# Altium schematic sheet USB Section.SchDoc: *USB Section
size A4; DocumentNumber: 3; SheetNumber: 3; SheetTotal: 7
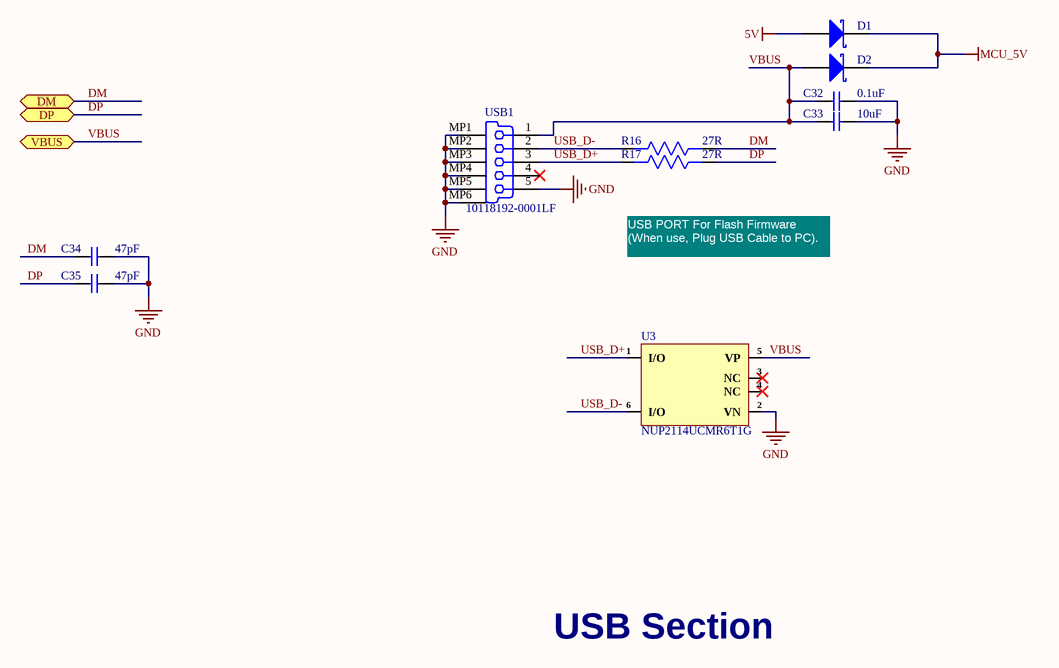
[diagram p0: USB Section.SchDoc]

## Parts
C32  0.1uF  [Cap0402]
C33  10uF  [Cap0402]
C34  47pF  [Cap0402]
C35  47pF  [Cap0402]
D1  PMEG3010ER,115  [SOD123W]  (value not drawn)
D2  PMEG3010ER,115  [SOD123W]  (value not drawn)
R16  27R  [Res0402]
R17  27R  [Res0402]
U3  NUP2114UCMR6T1G  [6-TSOP]
USB1  10118192-0001LF  [Micro Usb Conn SMD]

## Ports
DM (bidir), DP (bidir), VBUS (bidir)

## Nets
5V: D1.A
GND: C32.2 C33.2 C34.2 C35.2 U3.2(VN) USB1.5(GND) USB1.MP1(Tab) USB1.MP2(Tab) USB1.MP3(Tab) USB1.MP4(Tab) USB1.MP5(Tab) USB1.MP6(Tab)
MCU_5V: D1.K D2.K
DM: C34.1 R16.1 ; port DM
DP: C35.1 R17.1 ; port DP
USB_D+: R17.2 U3.1(I/O) USB1.3(D+)
USB_D-: R16.2 U3.6(I/O) USB1.2(D-)
VBUS: C32.1 C33.1 D2.A U3.5(VP) USB1.1(V_BUS_(5V)) ; port VBUS

Not connected (* = marked no-connect by the designer): U3 3(NC)* 4(NC)*; USB1 4(NC)*

## Notes on the sheet
- USB PORT For Flash Firmware
  (When use, Plug USB Cable to PC).
- USB Section

## Library data of the parts
C32 = CC0402KRX5R7BB104: CAP CER 0.1UF 16V X5R 0402; Manufacturer: Yageo; Capacitance: 100nF; Tolerance: 10%; Supplier 1: Digi-Key; Manufacturer Part Number: CC0402KRX5R7BB104; Stock 1: 2577166; Pricing 1: 1=0.1, 10=0.03, 100=0.0135, 500=0.0096, 1000=0.0076, 2500=0.0069, 5000=0.0063 (USD); Mount: Surface Mount; Case/Package: 0402; Number of Pins: 2; Case Code (Metric): 1005; Case Code (Imperial): 0402; Min Operating Temperature: -55°C; Max Operating Temperature: 85°C; Packaging: Tape and Reel; Voltage Rating: 16V; Package Quantity: 1; Voltage Rating (DC): 16V; Dielectric: X5R; Termination: SMD/SMT; Composition: Ceramic; Length: 1mm; Height: 0.5mm; Width: 0.02inch; Thickness: 0.022inch; Depth: 0.5mm; Radiation Hardening: No; REACH SVHC: Unknown; Lead Free: Lead Free; Halogen Free: Halogen Free; ComponentLink1URL: http://www.yageo.com/documents/recent/UPY-GPHC_X5R_4V-to-50V_12.pdf?src-supplier=Avnet; ComponentLink1Description: http://www.yageo.com/documents/recent/UPY-GPHC_X5R_4V-to-50V_12.pdf?src-supplier=Avnet; ComponentLink2URL: http://www.yageo.com/documents/recent/UPY-GPHC_X5R_4V-to-50V_25.pdf?src-supplier=Digi-Key; ComponentLink2Description: http://www.yageo.com/documents/recent/UPY-GPHC_X5R_4V-to-50V_25.pdf?src-supplier=Digi-Key; ComponentLink3URL: http://www.yageo.com/exep/pages/download/literatures/ProductSelectionGuide%202014_Final_2.pdf?src-supplier=Digi-Key; ComponentLink3Description: http://www.yageo.com/exep/pages/download/literatures/ProductSelectionGuide%202014_Final_2.pdf?src-supplier=Digi-Key; ComponentLink4URL: http://www.yageo.com/documents/recent/UPY-GPHC_X5R_4V-to-50V_12.pdf?src-supplier=Avnet+Europe; ComponentLink4Description: http://www.yageo.com/documents/recent/UPY-GPHC_X5R_4V-to-50V_12.pdf?src-supplier=Avnet+Europe; Supplier Part Number 1: 311-1347-1-ND
C33 = CL05A106MP8NUB8: CAP CER 10UF 10V X5R 0402; Manufacturer: Samsung; Tolerance: 20%; Supplier 1: Digi-Key; Manufacturer Part Number: CL05A106MP8NUB8; Stock 1: 1158256; Pricing 1: 1=0.45, 10=0.311, 100=0.1863, 500=0.13972, 1000=0.11799, 2500=0.11178 (USD); Mount: Surface Mount; Case/Package: 0402; Case Code (Metric): 1005; Case Code (Imperial): 0402; Min Operating Temperature: -55°C; Max Operating Temperature: 85°C; Packaging: Tape and Reel; Capacitance: 10uF; Voltage Rating: 10V; Length: 0.039inch; Width: 0.02inch; Thickness: 0.035inch; Supplier Part Number 1: 1276-6830-1-ND
C34 C35 = GCM1555C1H470JA16D: CAP CER 47PF 50V C0G/NP0 0402; Manufacturer: Murata; Tolerance: 5%; Supplier 1: Digi-Key; Manufacturer Part Number 1: GCM1555C1H470JA16D; Stock 1: 524245; Pricing 1: 1=0.1, 10=0.068, 100=0.0303, 500=0.0217, 1000=0.017, 2500=0.0155, 5000=0.0142 (USD); Mount: Surface Mount; Case/Package: 0402; Case Code (Metric): 1005; Case Code (Imperial): 0402; Min Operating Temperature: -55°C; Max Operating Temperature: 125°C; Packaging: Cut Tape; Capacitance: 47pF; Voltage Rating: 50V; Length: 0.039inch; Width: 0.02inch; Thickness: 0.022inch; Ratings: AEC-Q200; Lead Free: Lead Free; Supplier Part Number 1: 490-10670-1-ND
D1 D2 = PMEG3010ER,115: DIODE SCHOTTKY 30V 1A SOD123W; Manufacturer: Nexperia; Supplier 1: Digi-Key; Manufacturer Part Number: PMEG3010ER,115; Stock 1: 75070; Pricing 1: 1=0.36, 10=0.29, 100=0.1669, 500=0.1545, 1000=0.10506 (USD); Supplier Part Number 1: 1727-5201-1-ND
R16 R17 = RT0402FRE0727RL: RES SMD 27 OHM 1% 1/16W 0402; Manufacturer: Yageo; Power Rating: 62.5mW; Voltage Rating: 50V; Max Power Dissipation: 63mW; Temperature Coefficient: 50ppm/°C; Supplier 1: Digi-Key; Manufacturer Part Number 1: RT0402FRE0727RL; Stock 1: 26946; Pricing 1: 1=0.1, 10=0.072, 100=0.0277, 1000=0.0122, 2500=0.0105, 5000=0.0094 (USD); Case/Package: 0402; Case Code (Metric): 1005; Case Code (Imperial): 0402; Min Operating Temperature: -55°C; Max Operating Temperature: 125°C; Resistance: 27R; Tolerance: 1%; Packaging: Tape and Reel; Package Quantity: 10000; Composition: Thin Film; Number of Terminations: 2; Termination: SMD/SMT; Military Standard: Not; Voltage Rating (DC): 50V; Features: Moisture Resistant; Length: 1mm; Height: 0.014inch; Width: 0.02inch; Depth: 0.5mm; Lead Free: Lead Free; ComponentLink1URL: http://www.yageo.com/NewPortal/yageodocoutput?fileName=/pdf/R-Chip/PYu-RT_1-to-0.05_RoHS_L_5.pdf&src-supplier=Digi-Key; ComponentLink1Description: http://www.yageo.com/NewPortal/yageodocoutput?fileName=/pdf/R-Chip/PYu-RT_1-to-0.05_RoHS_L_5.pdf&src-supplier=Digi-Key; ComponentLink2URL: http://www.mouser.com/ds/2/447/yageodocoutput-1125656.pdf?src-supplier=Mouser; ComponentLink2Description: http://www.mouser.com/ds/2/447/yageodocoutput-1125656.pdf?src-supplier=Mouser; Supplier Part Number 1: YAG3343CT-ND
U3 = NUP2114UCMR6T1G: TVS DIODE 5VWM 10VC 6TSOP; Manufacturer: onsemi; Manufacturer Lifecycle Status: ACTIVE; Item Type: TVS Diodes; Breakdown Voltage: 7.5V; Value: 1pF; Clamping Voltage: 12V; Direction: Unidirectional; Element Configuration: Single; ESD Protection: Yes; Leakage Current: 1µA; Max Surge Current: 19A; Min Breakdown Voltage: 6V; Number of Bidirectional Channels: 2; Number of Channels: 1; Operating Supply Voltage: 5V; Peak Pulse Current: 8A; Test Current: 1mA; Supplier: DigiKey; LCSC Part Number: C393373; Manufacturer Part Number: NUP2114UCMR6T1G; RoHS: Compliant; Stock: 34630; Pricing: 1=0.81, 10=0.5, 100=0.3234, 500=0.24708, 1000=0.22246 (USD); Case/Package: TSOP; China RoHS: Compliant; Contact Plating: Tin; Depth: 1.5mm; Halogen Free: Halogen Free; Height: 1mm; Lead Free: Lead Free; Length: 3mm; Lifecycle Status: Production; Max Breakdown Voltage: 7.5V; Max Operating Temperature: 125°C; Max Reverse Leakage Current: 1µA; Min Operating Temperature: -40°C; Number of Elements: 1; Number of Lines: 2; Pins: 6; Number of Terminals: 6; Packaging: Tape and Reel; Peak Reverse Current: 1µA; Polarity: Unidirectional; Power Line Protection: Yes; Radiation Hardening: No; REACH SVHC: Yes; Reverse Standoff Voltage: 5V; Schedule B: 8536300000, 8536300000|8536300000|8536300000|8536300000|8536300000|8536300000|8536300000|8536300000|8536300000|8536300000|8536300000|8536300000|8536300000|8536300000|8536300000|8536300000|8536300000|8536300000|8536300000|8536300000|8536300000|8536300000|8536300000|85; Width: 1.7mm; Working Voltage: 5V; ComponentLink1URL: https://datasheet.octopart.com:443/NUP2114UCMR6T1G-onsemi-datasheet-180968601.pdf?src-supplier=IHS; ComponentLink1Description: https://datasheet.octopart.com:443/NUP2114UCMR6T1G-onsemi-datasheet-180968601.pdf?src-supplier=IHS; ComponentLink2URL: https://datasheet.octopart.com:443/NUP2114UCMR6T1G-ON-Semiconductor-datasheet-139013348.pdf?src-supplier=Upverter; ComponentLink2Description: https://datasheet.octopart.com:443/NUP2114UCMR6T1G-ON-Semiconductor-datasheet-139013348.pdf?src-supplier=Upverter; ComponentLink3URL: https://datasheet.octopart.com:443/NUP2114UCMR6T1G-ON-Semiconductor-datasheet-12517220.pdf?src-supplier=JRH+Electronics; ComponentLink3Description: https://datasheet.octopart.com:443/NUP2114UCMR6T1G-ON-Semiconductor-datasheet-12517220.pdf?src-supplier=JRH+Electronics; ComponentLink4URL: https://datasheet.octopart.com:443/NUP2114UCMR6T1G-ON-Semiconductor-datasheet-93402670.pdf?src-supplier=Newark; ComponentLink4Description: https://datasheet.octopart.com:443/NUP2114UCMR6T1G-ON-Semiconductor-datasheet-93402670.pdf?src-supplier=Newark; ComponentLink5URL: https://datasheet.octopart.com:443/NUP2114UCMR6T1G-ON-Semiconductor-datasheet-11781058.pdf?src-supplier=Arrow+Electronics; ComponentLink5Description: https://datasheet.octopart.com:443/NUP2114UCMR6T1G-ON-Semiconductor-datasheet-11781058.pdf?src-supplier=Arrow+Electronics; ComponentLink6URL: http://sigma.octopart.com:80/15540786/rohs_certificate/ON-Semiconductor-NUP2114UCMR6T1G.pdf?src-supplier=Compliance+Statements; ComponentLink6Description: http://sigma.octopart.com:80/15540786/rohs_certificate/ON-Semiconductor-NUP2114UCMR6T1G.pdf?src-supplier=Compliance+Statements; ComponentLink7URL: http://sigma.octopart.com:80/15684254/materials_sheet/ON-Semiconductor-NUP2114UCMR6T1G.csv?src-supplier=Compliance+Statements; ComponentLink7Description: http://sigma.octopart.com:80/15684254/materials_sheet/ON-Semiconductor-NUP2114UCMR6T1G.csv?src-supplier=Compliance+Statements; ComponentLink8URL: http://sigma.octopart.com:80/150629776/rohs_statement/ON-Semiconductor-NUP2114UCMR6T1G.pdf?src-supplier=Compliance+Statements; ComponentLink8Description: http://sigma.octopart.com:80/150629776/rohs_statement/ON-Semiconductor-NUP2114UCMR6T1G.pdf?src-supplier=Compliance+Statements; ComponentLink9URL: http://sigma.octopart.com:80/reach_statement/ON-Semiconductor-company-79.pdf?src-supplier=Compliance+Statements; ComponentLink9Description: http://sigma.octopart.com:80/reach_statement/ON-Semiconductor-company-79.pdf?src-supplier=Compliance+Statements; ComponentLink10URL: https://octopart.com:443/opatz8j6/c1?t=WHQR9uYdgpzj_1pscu76jQl6SgdNYEFCsB45f32wZZoFxCsQNnTKjjNsMYmP8-tNAzH3PllWfDzCrm21sm3O0yX6Z-53NNC5eFJr5XbJGHdORXd5PF3OOo3CImUBKNeQS3HmN9uPOWjBWXFdunIc45LQOJ5gn3633PacQX-_VlsFFggQuFkNQdU_reWhDfM_aJjhbu9NdAkiBle4rEQKmYnaoI-ZpXvRqCCi0hGZ9pE0dY1iMvStjDVJm3RbKYgavDmI8RSqtgWwHOO5VIrlYvErgV0U4ccu7WiifKCK2DwQWrnPYcBzCgFR9XOWz9r3-48fB14U1Lqb5JaFbo5XHNFFjMaufSDK6ZmMxG1n87oH0pc&src-supplier=Compliance+Statements; ComponentLink10Description: https://octopart.com:443/opatz8j6/c1?t=WHQR9uYdgpzj_1pscu76jQl6SgdNYEFCsB45f32wZZoFxCsQNnTKjjNsMYmP8-tNAzH3PllWfDzCrm21sm3O0yX6Z-53NNC5eFJr5XbJGHdORXd5PF3OOo3CImUBKNeQS3HmN9uPOWjBWXFdunIc45LQOJ5gn3633PacQX-_VlsFFggQuFkNQdU_reWhDfM_aJjhbu9NdAkiBle4rEQKmYnaoI-ZpXvRqCCi0hGZ9pE0dY1iMvStjDVJm3RbKYgavDmI8RSqtgWwHOO5VIrlYvErgV0U4ccu7WiifKCK2DwQWrnPYcBzCgFR9XOWz9r3-48fB14U1Lqb5JaFbo5XHNFFjMaufSDK6ZmMxG1n87oH0pc&src-supplier=Compliance+Statements; ComponentLink11URL: https://octopart.com:443/opatz8j6/c1?t=VqVTyc6VXqTBoXsnuoG7LjY3mp2KX-eKzPIkg7aySNunBFpm0IQnkmc826qVFZhglS6vaf-VvqwaWaROfS_iErSVq9YUUuVgokCDv5Vhxq2pu1cn-vrRw1TlcFDaGbodQB-atNY6UP6gD2sOO8NRAoQTemD37mLChF1Rt1bpz95WWhJ_wI0XqbdDN8V1Apvbq8ufNLXwMMdHk5jYglIDCz4WpJf5DoTt1BP_MBv-tXAye_NcKa095654jMt3sjm_6RuC2vVrkcCpfXNjjgvjYPsYUvKBiXeM6Xjzw9honyCE0JlgCVT7WXyyf_6oP9kIrOXlSICGvfIO1US9YbBHujA-CLkGpoYI906K6Xw-TlpUog&src-supplier=Compliance+Statements; ComponentLink11Description: https://octopart.com:443/opatz8j6/c1?t=VqVTyc6VXqTBoXsnuoG7LjY3mp2KX-eKzPIkg7aySNunBFpm0IQnkmc826qVFZhglS6vaf-VvqwaWaROfS_iErSVq9YUUuVgokCDv5Vhxq2pu1cn-vrRw1TlcFDaGbodQB-atNY6UP6gD2sOO8NRAoQTemD37mLChF1Rt1bpz95WWhJ_wI0XqbdDN8V1Apvbq8ufNLXwMMdHk5jYglIDCz4WpJf5DoTt1BP_MBv-tXAye_NcKa095654jMt3sjm_6RuC2vVrkcCpfXNjjgvjYPsYUvKBiXeM6Xjzw9honyCE0JlgCVT7WXyyf_6oP9kIrOXlSICGvfIO1US9YbBHujA-CLkGpoYI906K6Xw-TlpUog&src-supplier=Compliance+Statements
USB1 = Micro Usb Conn SMD: CONN USB MICRO B RECPT SMT R/A; Manufacturer: Amphenol FCI; Gender: Receptacle; Current Rating: 1.8A; Connector Type: USB,Receptacle; Number of Contacts: 5; Insulation Resistance: 1GR; Number of Ports: 1; Max Voltage Rating (AC): 100V; USB Standard: USB 2.0; Pitch: 0.65mm; Supplier 1: Digi-Key; Manufacturer Part Number: 10118192-0001LF; Stock 1: 203283; Pricing 1: 1=0.42, 10=0.393, 25=0.3536, 50=0.3144, 100=0.3013, 250=0.2751, 500=0.262 (USD); Mount: Surface Mount,Horizontal; Contact Material: Copper Alloy; Contact Plating: Nickel,Gold; Colour: Black; Number of Terminals: 5; Housing Material: Polymer; Min Operating Temperature: -55°C; Max Operating Temperature: 85°C; Termination: Solder; Orientation: Right Angle; Packaging: Tape and Reel; Package Quantity: 1400; Voltage Rating: 100V; Length: 7.86mm; Depth: 5.57mm; Radiation Hardening: No; Lead Free: Lead Free; Flammability Rating: UL94 V-0; REACH SVHC: No SVHC; ComponentLink1URL: https://datasheet.ciiva.com/26853/getdatasheetpartid-418041-26853891.pdf; ComponentLink1Description: https://datasheet.ciiva.com/26853/getdatasheetpartid-418041-26853891.pdf; ComponentLink2URL: https://datasheet.ciiva.com/851/10118192-851112.pdf; ComponentLink2Description: https://datasheet.ciiva.com/851/10118192-851112.pdf; ComponentLink3URL: https://datasheet.ciiva.com/4598/10118192ac-197249-4598796.pdf; ComponentLink3Description: https://datasheet.ciiva.com/4598/10118192ac-197249-4598796.pdf; Supplier Part Number 1: 609-4613-1-ND